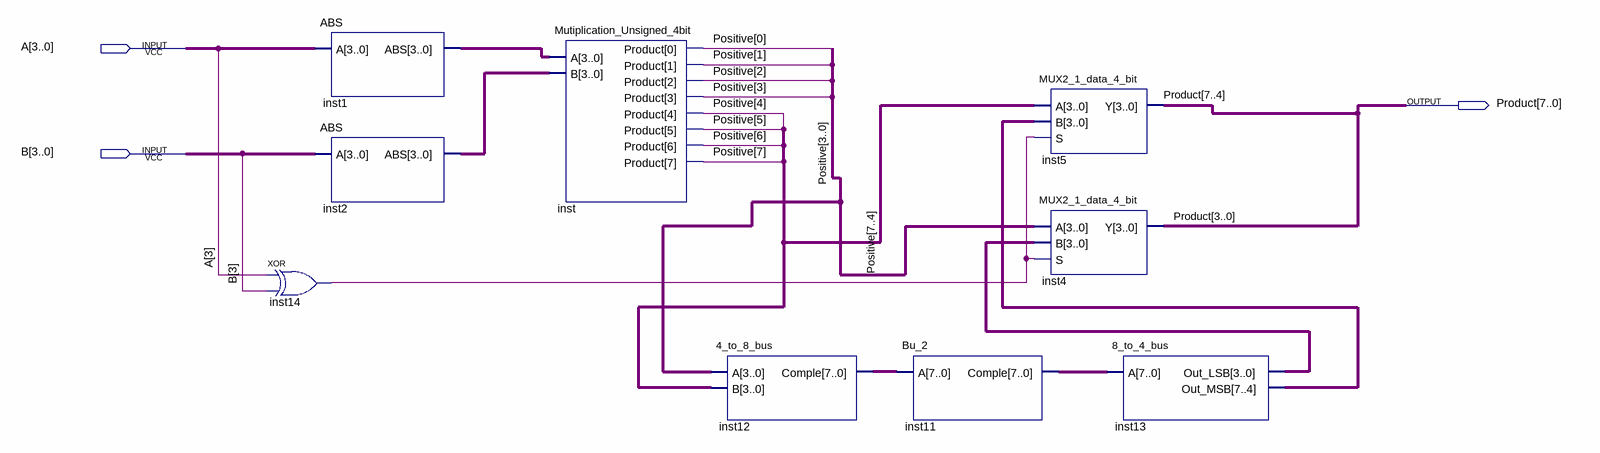
[diagram p0: schematic sheet]
// Quartus schematic cau2_co_dau.bdf as structural Verilog: 9 symbols, 3 pins
module cau2_co_dau (
  input  [3:0] A,
  input  [3:0] B,
  output [7:0] Product
);

  wire inst14_out;
  wire [3:0] inst1_abs, inst2_abs, inst13_out_lsb, inst13_out_msb;
  wire [7:0] inst11_comple, inst12_comple, Positive;

  xor inst14 (inst14_out, A[3], B[3]);
  ABS inst1 (.A(A), .ABS(inst1_abs));
  ABS inst2 (.A(B), .ABS(inst2_abs));
  Mutiplication_Unsigned_4bit inst (.A(inst1_abs), .B(inst2_abs), .Product(Positive));
  \4_to_8_bus  inst12 (.A(Positive[3:0]), .B(Positive[7:4]), .Comple(inst12_comple));
  Bu_2 inst11 (.A(inst12_comple), .Comple(inst11_comple));
  MUX2_1_data_4_bit inst5 (.A(Positive[7:4]), .B(inst13_out_msb), .S(inst14_out), .Y(Product[7:4]));
  MUX2_1_data_4_bit inst4 (.A(Positive[3:0]), .B(inst13_out_lsb), .S(inst14_out), .Y(Product[3:0]));
  \8_to_4_bus  inst13 (.A(inst11_comple), .Out_LSB(inst13_out_lsb), .Out_MSB(inst13_out_msb));
endmodule
